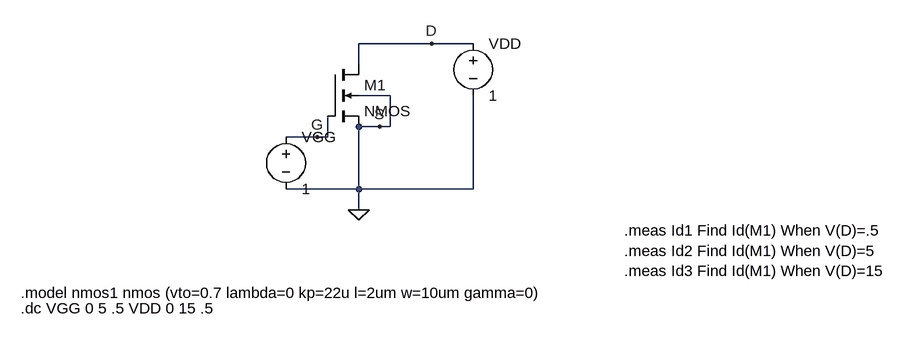
[diagram p0: schematic Mosfet2.asc]
Mosfet2.asc, the LTspice schematic file:
Version 4.1
SHEET 1 980 680
WIRE 240 64 128 64
WIRE 304 64 240 64
WIRE 128 96 128 64
WIRE 176 144 128 144
WIRE 160 192 128 192
WIRE 176 192 176 144
WIRE 176 192 160 192
WIRE 64 208 16 208
WIRE 80 208 80 176
WIRE 80 208 64 208
WIRE 128 288 128 192
WIRE 128 288 16 288
WIRE 304 288 304 144
WIRE 304 288 128 288
WIRE 128 320 128 288
FLAG 128 320 0
FLAG 64 208 G
FLAG 160 192 S
FLAG 240 64 D
SYMBOL nmos4 80 96 R0
SYMATTR InstName M1
SYMBOL voltage 16 192 R0
WINDOW 123 0 0 Left 0
WINDOW 39 0 0 Left 0
SYMATTR InstName VGG
SYMATTR Value 1
SYMBOL voltage 304 48 R0
WINDOW 123 0 0 Left 0
WINDOW 39 0 0 Left 0
SYMATTR InstName VDD
SYMATTR Value 1
TEXT -392 448 Left 2 !.model nmos1 nmos (vto=0.7 lambda=0 kp=22u l=2um w=10um gamma=0)
TEXT 536 352 Left 2 !.meas Id1 Find Id(M1) When V(D)=.5\n.meas Id2 Find Id(M1) When V(D)=5\n.meas Id3 Find Id(M1) When V(D)=15
TEXT -392 472 Left 2 !.dc VGG 0 5 .5 VDD 0 15 .5

The netlist it stands for:
* Mosfet2.asc
M1 D G 0 0 NMOS
VGG G 0 1
VDD D 0 1
.model NMOS NMOS
.model PMOS PMOS
.lib standard.mos
.model nmos1 nmos (vto=0.7 lambda=0 kp=22u l=2um w=10um gamma=0)
.meas Id1 Find Id(M1) When V(D)=.5
.meas Id2 Find Id(M1) When V(D)=5
.meas Id3 Find Id(M1) When V(D)=15
.dc VGG 0 5 .5 VDD 0 15 .5
.backanno
.end